# EasyEDA Pro project ProPrj_Wone Switch_2026-03-04-15-16-57.epro

# Schematic Schematic1
Board Name: Board1; Create Date: 2026-03-04; Page Name: P1; Project Name: Wone Switch; Schematic Name: Schematic1; Update Date: 2026-03-04; Company: EasyEDA.com; Page Size: A4; Version: V1.0
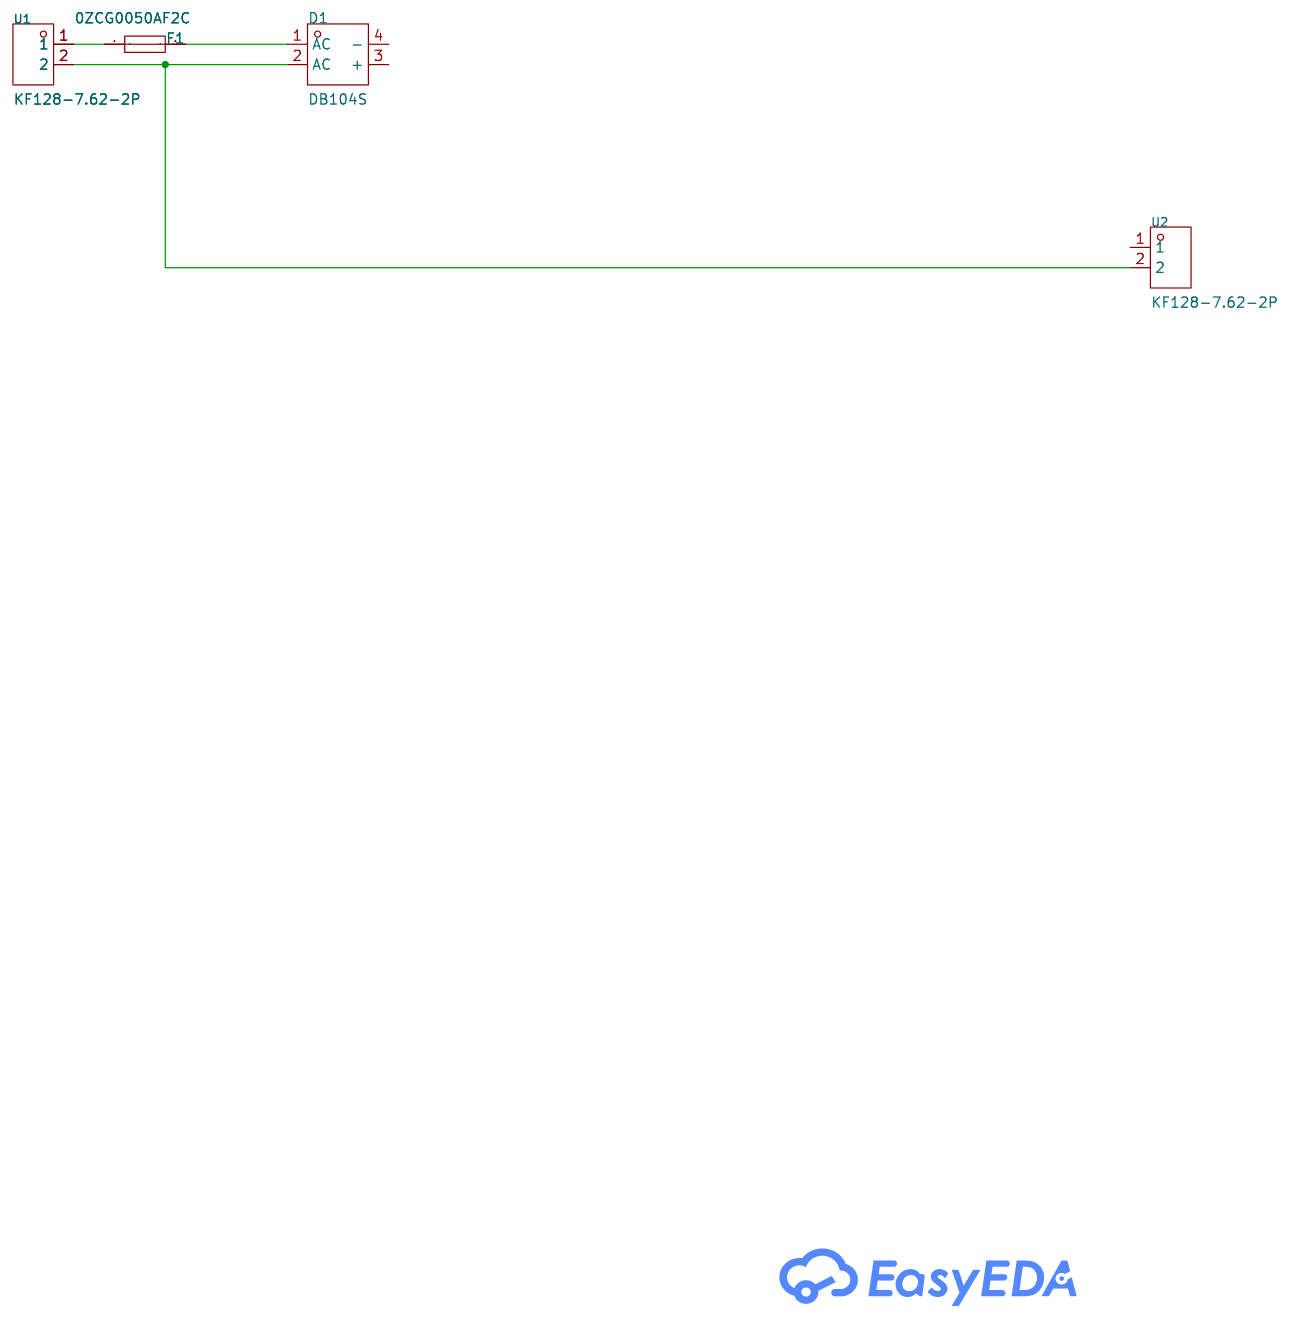
[diagram p0: schematic sheet]

## Parts
D1  DB104S  [DBS_L8.4-W6.4-P5.10-LS10.2-TL]
F1  0ZCG0050AF2C  [F1812]
U1  KF128-7.62-2P  [CONN-TH_P7.62_KF128-7.62-2P]
U2  KF128-7.62-2P  [CONN-TH_P7.62_KF128-7.62-2P]

## Library data of the parts
D1 = DB104S_C5174635: Voltage - Forward(Vf@If):1.1V@1A Voltage - DC Reverse(Vr):400V Current - Rectified:1A Reverse Leakage Current (Ir):10uA@400V Non-Repetitive Peak Forward Surge Current:50A Operating Junction Temperature Range:-55℃~+150℃ Operating Junction Temperature Range; Supplier Part: C5174635; Manufacturer: MSKSEMI(美森科); Supplier Footprint: DBS; JLCPCB Part Class: Extended Part; Datasheet: https://item.szlcsc.com/datasheet/DB104S/5827004.html; Supplier: LCSC; Voltage - Forward(Vf@If): 1.1V@1A; Voltage - DC Reverse(Vr): 400V; Current - Rectified: 1A; Reverse Leakage Current (Ir): 10uA@400V; Non-Repetitive Peak Forward Surge Current: 50A; Operating Junction Temperature Range: -55℃~+150℃
F1 = 0ZCG0050AF2C: Voltage - Max:30V Current - Max:100A Hold Current:500mA Trip Current:1A Power Dissipation:800mW Resistance - Initial (Ri) (Min):150mΩ Resistance - Post Trip (R1) (Max):1Ω Time to Trip(Max):150ms Operating Temperature:-40℃~+85℃ Operating Temperature:-40℃~+; LCSC Part Name: 30V 500mA 自恢复; Supplier Part: C3762102; Manufacturer: belfuse; Supplier Footprint: 1812; JLCPCB Part Class: Extended Part; Datasheet: https://item.szlcsc.com/datasheet/0ZCG0050AF2C/4329633.html; Supplier: LCSC; Voltage - Max: 30V; Current - Max: 100A; Hold Current: 500mA; Trip Current: 1A; Power Dissipation: 800mW; Resistance - Initial (Ri) (Min): 150mΩ; Resistance - Post Trip (R1) (Max): 1Ω; Time to Trip(Max): 150ms; Operating Temperature: -40℃~+85℃
U1 U2 = KF128-7.62-2P: Number of Positions or Pins:1x2P Pitch:7.62mm Color:Green Mounting Type:Through Hole Number of Pins:2P Number of Rows:1 Number of PINs Per Row:2 Current Rating:24A Voltage Rating (Max):450V Wire Gauge - AWG:12~22 Wire Gauge - mm2:2.5 Wire Gauge - mm2:2.5; LCSC Part Name: 1x2P 7.62mm 直插 排数:1 每排P数:2; Supplier Part: C474956; Manufacturer: KEFA(科发); Supplier Footprint: 插件,P=7.62mm; JLCPCB Part Class: Extended Part; Datasheet: https://item.szlcsc.com/datasheet/KF128-7.62-2P/481574.html; Supplier: LCSC; Number of Positions or Pins: 1x2P; Pitch: 7.62mm; Color: Green; Mounting Type: Through Hole; Number of Pins: 2P; Number of Rows: 1; Number of PINs Per Row: 2; Current Rating: 24A; Voltage Rating (Max): 450V; Wire Gauge - AWG: 12~22; Wire Gauge - mm2: 2.5; Operating Temperature: -40℃~+105℃

## Nets
Net-(D1-1): D1.1(AC) F1.2
Net-(D1-2): D1.2(AC) U1.2 U2.2
Net-(F1-1): F1.1 U1.1

Not connected (* = marked no-connect by the designer): D1 3(+) 4(-); U2 1
